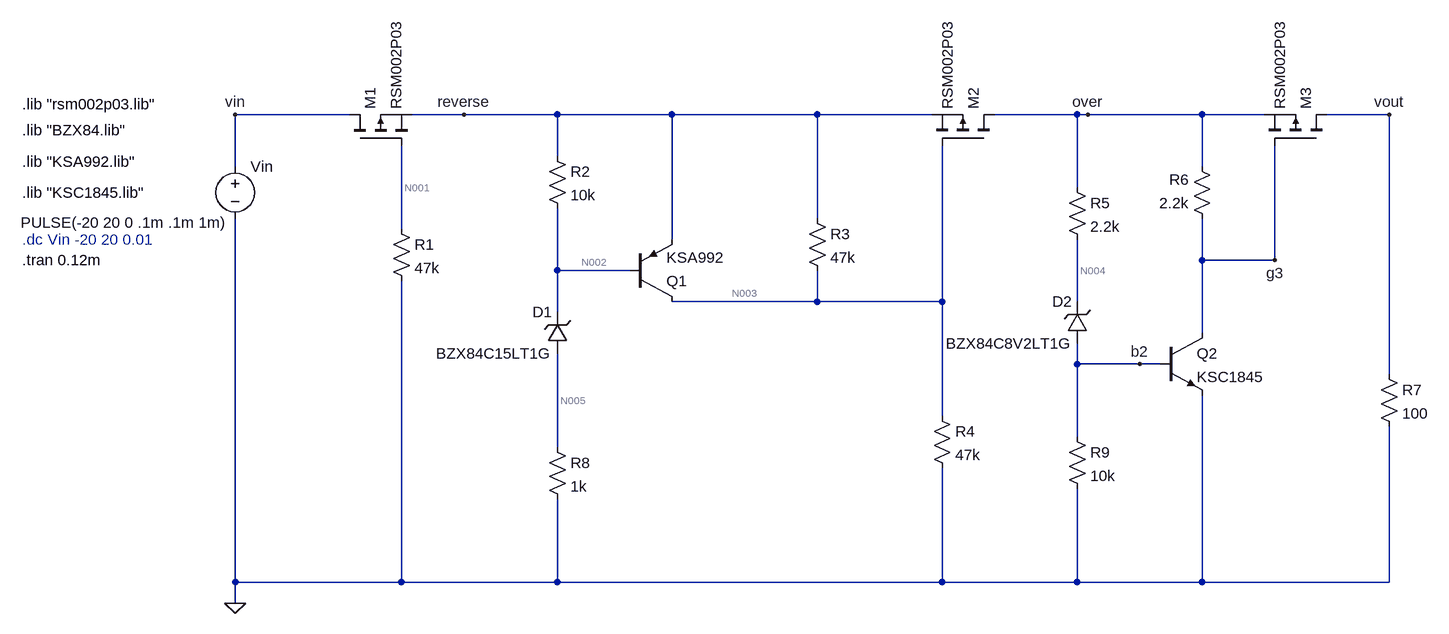
[diagram p0: schematic A5 Assynchronous Assignment 5 Electrical Protection.asc]
A5 Assynchronous Assignment 5 Electrical Protection.asc, the LTspice schematic file:
Version 4.1
SHEET 1 3092 1620
WIRE -192 848 -368 848
WIRE -16 848 -96 848
WIRE 128 848 -16 848
WIRE 304 848 128 848
WIRE 528 848 304 848
WIRE 704 848 528 848
WIRE 928 848 800 848
WIRE 944 848 928 848
WIRE 1120 848 944 848
WIRE 1216 848 1120 848
WIRE 1408 848 1312 848
WIRE 128 912 128 848
WIRE -368 928 -368 848
WIRE 1120 928 1120 848
WIRE 928 960 928 848
WIRE 528 1008 528 848
WIRE -112 1024 -112 896
WIRE 304 1040 304 848
WIRE 1120 1072 1120 1008
WIRE 1232 1072 1232 896
WIRE 1232 1072 1120 1072
WIRE 128 1088 128 992
WIRE 240 1088 128 1088
WIRE 528 1136 528 1088
WIRE 528 1136 304 1136
WIRE 720 1136 720 896
WIRE 720 1136 528 1136
WIRE 928 1136 928 1040
WIRE 128 1152 128 1088
WIRE 1120 1184 1120 1072
WIRE 928 1232 928 1200
WIRE 1024 1232 928 1232
WIRE 1056 1232 1024 1232
WIRE 1408 1248 1408 848
WIRE 720 1312 720 1136
WIRE 928 1344 928 1232
WIRE 128 1360 128 1216
WIRE -368 1568 -368 1008
WIRE -112 1568 -112 1104
WIRE -112 1568 -368 1568
WIRE 128 1568 128 1440
WIRE 128 1568 -112 1568
WIRE 720 1568 720 1392
WIRE 720 1568 128 1568
WIRE 928 1568 928 1424
WIRE 928 1568 720 1568
WIRE 1120 1568 1120 1280
WIRE 1120 1568 928 1568
WIRE 1408 1568 1408 1328
WIRE 1408 1568 1120 1568
WIRE -368 1600 -368 1568
FLAG -368 1600 0
FLAG -368 848 vin
FLAG 1408 848 vout
FLAG -16 848 reverse
FLAG 944 848 over
FLAG 1232 1072 g3
FLAG 1024 1232 b2
SYMBOL voltage -368 912 R0
WINDOW 3 -330 102 Left 2
WINDOW 123 0 0 Left 0
WINDOW 39 0 0 Left 0
SYMATTR Value PULSE(-20 20 0 .1m .1m 1m)
SYMATTR InstName Vin
SYMBOL res 112 896 R0
SYMATTR InstName R2
SYMATTR Value 10k
SYMBOL res 704 1296 R0
SYMATTR InstName R4
SYMATTR Value 47k
SYMBOL res 1392 1232 R0
SYMATTR InstName R7
SYMATTR Value 100
SYMBOL pnp 240 1136 M180
SYMATTR InstName Q1
SYMATTR Value KSA992
SYMBOL zener 144 1216 R180
WINDOW 0 24 64 Left 2
WINDOW 3 24 0 Left 2
SYMATTR InstName D1
SYMATTR Value BZX84C15LT1G
SYMATTR Prefix X
SYMBOL res -128 1008 R0
SYMATTR InstName R1
SYMATTR Value 47k
SYMBOL zener 944 1200 R180
WINDOW 0 24 64 Left 2
WINDOW 3 24 0 Left 2
SYMATTR InstName D2
SYMATTR Value BZX84C8V2LT1G
SYMATTR Prefix X
SYMBOL npn 1056 1184 R0
SYMATTR InstName Q2
SYMATTR Value KSC1845
SYMBOL res 912 944 R0
SYMATTR InstName R5
SYMATTR Value 2.2k
SYMBOL res 512 992 R0
SYMATTR InstName R3
SYMATTR Value 47k
SYMBOL res 1136 1024 R180
WINDOW 0 36 76 Left 2
WINDOW 3 36 40 Left 2
SYMATTR InstName R6
SYMATTR Value 2.2k
SYMBOL pmos 1312 896 M270
SYMATTR InstName M3
SYMATTR Value RSM002P03
SYMATTR Prefix X
SYMBOL pmos 800 896 M270
SYMATTR InstName M2
SYMATTR Value RSM002P03
SYMATTR Prefix X
SYMBOL pmos -192 896 R270
SYMATTR InstName M1
SYMATTR Value RSM002P03
SYMATTR Prefix X
SYMBOL res 112 1344 R0
SYMATTR InstName R8
SYMATTR Value 1k
SYMBOL res 912 1328 R0
SYMATTR InstName R9
SYMATTR Value 10k
TEXT -696 1040 Left 2 ;.dc Vin -20 20 0.01
TEXT -696 832 Left 2 !.lib "rsm002p03.lib"
TEXT -696 872 Left 2 !.lib "BZX84.lib"
TEXT -696 920 Left 2 !.lib "KSA992.lib"
TEXT -696 968 Left 2 !.lib "KSC1845.lib"
TEXT -696 1072 Left 2 !.tran 0.12m

The netlist it stands for:
* A5 Assynchronous Assignment 5 Electrical Protection.asc
Vin vin 0 PULSE(-20 20 0 .1m .1m 1m)
R2 reverse N002 10k
R4 N003 0 47k
R7 vout 0 100
Q1 N003 N002 reverse 0 KSA992
X§D1 N005 N002 BZX84C15LT1G  ; pins + -
R1 N001 0 47k
X§D2 b2 N004 BZX84C8V2LT1G  ; pins + -
Q2 g3 b2 0 0 KSC1845
R5 over N004 2.2k
R3 reverse N003 47k
R6 g3 over 2.2k
X§M3 vout g3 over RSM002P03  ; pins D G S
X§M2 over N003 reverse RSM002P03  ; pins D G S
X§M1 vin N001 reverse RSM002P03  ; pins D G S
R8 N005 0 1k
R9 b2 0 10k
.model NPN NPN
.model PNP PNP
.lib standard.bjt
* .dc Vin -20 20 0.01
.lib "rsm002p03.lib"
.lib "BZX84.lib"
.lib "KSA992.lib"
.lib "KSC1845.lib"
.tran 0.12m
.backanno
.end

* Results of the author's LTspice run, read from the files saved beside the schematic
* Operating Point, zero values left out:
*   V(b2) = -14.15 µV
*   V(g3) = -9.931 mV
*   V(n001) = -940 nV
*   V(n002) = -62.27 mV
*   V(n003) = -31.14 mV
*   V(n004) = -9.928 mV
*   V(n005) = -418.1 nV
*   V(over) = -9.931 mV
*   V(reverse) = -62.27 mV
*   V(vin) = -20 V
*   V(vout) = -33.12 nV
*   I(R1) = -20 pA
*   I(R2) = -423 pA
*   I(R3) = -662.5 nA
*   I(R4) = -662.5 nA
*   I(R5) = -1.414 nA
*   I(R6) = 1.442 pA
*   I(R7) = -331.2 pA
*   I(R8) = -418.1 pA
*   I(R9) = -1.415 nA
*   I(Vin) = 664.7 nA
*   Ib(Q1) = -4.887 pA
*   Ib(Q2) = 1.194 pA
*   Ic(Q1) = 5.83 pA
*   Ic(Q2) = -1.432 pA
*   Ix(d1:1) = -418.1 pA
*   Ix(d1:2) = 418.1 pA
*   Ix(d2:1) = -1.414 nA
*   Ix(d2:2) = 1.414 nA
*   Ix(m1:1) = -664.7 nA
*   Ix(m1:2) = 20 pA
*   Ix(m1:3) = 664.7 nA
*   Ix(m2:1) = 1.746 nA
*   Ix(m2:3) = -1.746 nA
*   Ix(m3:1) = 331.2 pA
*   Ix(m3:3) = -331.2 pA
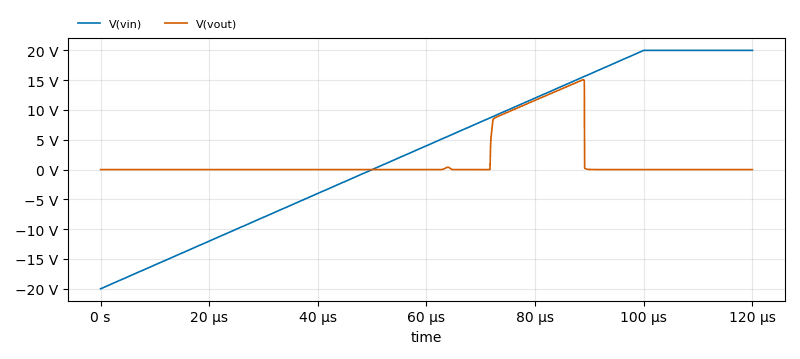
[diagram p1: Transient Analysis of A5 Assynchronous Assignment 5 Electrical Protection.asc, plotted from the saved traces]
* Transient Analysis, 1 run:
*   V(vin): min -20 V, max 20 V, average 3.333 V, rms 13.33 V, last 20 V
*   V(vout): min -3.891 mV, max 15.09 V, average 1.697 V, rms 4.525 V, last -18.87 µV